# Altium schematic sheet stm32h750.SchDoc
size A3; SheetNumber: 16; SheetTotal: 18
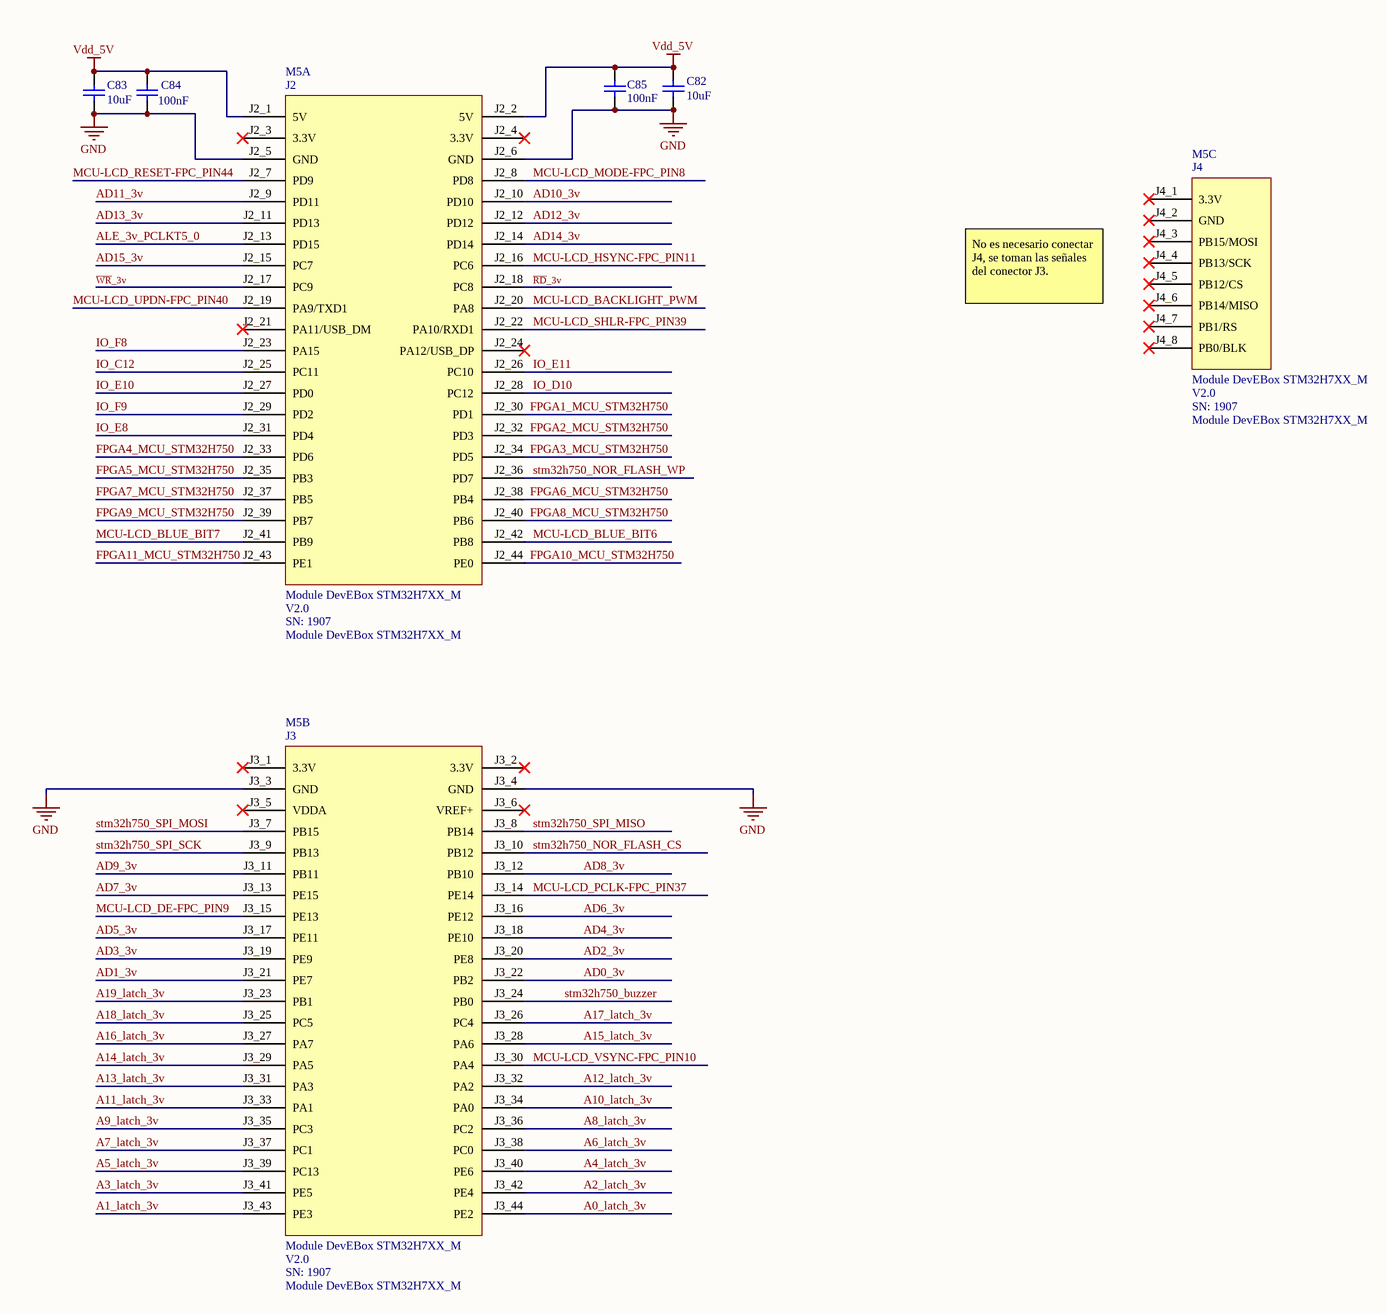
[diagram p0: stm32h750.SchDoc]

## Parts
C82  value 10uF  [capacitor 0603]  (hidden comment: ceramic capacitor)
C83  value 10uF  [capacitor 0603]  (hidden comment: ceramic capacitor)
C84  value 100nF  [capacitor 0603]  (hidden comment: Ceramic capacitor)
C85  value 100nF  [capacitor 0603]  (hidden comment: Ceramic capacitor)
M5  Module DevEBox STM32H7XX_M  [Module DevEBox STM32H7XX_M]  (parts A,B,C of 3)

## Nets
GND: C82.1 C83.1 C84.1 C85.1 M5.J2_5(GND) M5.J2_6(GND) M5.J3_3(GND) M5.J3_4(GND)
Vdd_5V: C82.2 C83.2 C84.2 C85.2 M5.J2_1(5V) M5.J2_2(5V)
A0_latch_3v: M5.J3_44(PE2)
A1_latch_3v: M5.J3_43(PE3)
A2_latch_3v: M5.J3_42(PE4)
A3_latch_3v: M5.J3_41(PE5)
A4_latch_3v: M5.J3_40(PE6)
A5_latch_3v: M5.J3_39(PC13)
A6_latch_3v: M5.J3_38(PC0)
A7_latch_3v: M5.J3_37(PC1)
A8_latch_3v: M5.J3_36(PC2)
A9_latch_3v: M5.J3_35(PC3)
A10_latch_3v: M5.J3_34(PA0)
A11_latch_3v: M5.J3_33(PA1)
A12_latch_3v: M5.J3_32(PA2)
A13_latch_3v: M5.J3_31(PA3)
A14_latch_3v: M5.J3_29(PA5)
A15_latch_3v: M5.J3_28(PA6)
A16_latch_3v: M5.J3_27(PA7)
A17_latch_3v: M5.J3_26(PC4)
A18_latch_3v: M5.J3_25(PC5)
A19_latch_3v: M5.J3_23(PB1)
AD0_3v: M5.J3_22(PB2)
AD1_3v: M5.J3_21(PE7)
AD2_3v: M5.J3_20(PE8)
AD3_3v: M5.J3_19(PE9)
AD4_3v: M5.J3_18(PE10)
AD5_3v: M5.J3_17(PE11)
AD6_3v: M5.J3_16(PE12)
AD7_3v: M5.J3_13(PE15)
AD8_3v: M5.J3_12(PB10)
AD9_3v: M5.J3_11(PB11)
AD10_3v: M5.J2_10(PD10)
AD11_3v: M5.J2_9(PD11)
AD12_3v: M5.J2_12(PD12)
AD13_3v: M5.J2_11(PD13)
AD14_3v: M5.J2_14(PD14)
AD15_3v: M5.J2_15(PC7)
ALE_3v_PCLKT5_0: M5.J2_13(PD15)
FPGA1_MCU_STM32H750: M5.J2_30(PD1)
FPGA2_MCU_STM32H750: M5.J2_32(PD3)
FPGA3_MCU_STM32H750: M5.J2_34(PD5)
FPGA4_MCU_STM32H750: M5.J2_33(PD6)
FPGA5_MCU_STM32H750: M5.J2_35(PB3)
FPGA6_MCU_STM32H750: M5.J2_38(PB4)
FPGA7_MCU_STM32H750: M5.J2_37(PB5)
FPGA8_MCU_STM32H750: M5.J2_40(PB6)
FPGA9_MCU_STM32H750: M5.J2_39(PB7)
FPGA10_MCU_STM32H750: M5.J2_44(PE0)
FPGA11_MCU_STM32H750: M5.J2_43(PE1)
IO_C12: M5.J2_25(PC11)
IO_D10: M5.J2_28(PC12)
IO_E8: M5.J2_31(PD4)
IO_E10: M5.J2_27(PD0)
IO_E11: M5.J2_26(PC10)
IO_F8: M5.J2_23(PA15)
IO_F9: M5.J2_29(PD2)
MCU-LCD_BACKLIGHT_PWM: M5.J2_20(PA8)
MCU-LCD_BLUE_BIT6: M5.J2_42(PB8)
MCU-LCD_BLUE_BIT7: M5.J2_41(PB9)
MCU-LCD_DE-FPC_PIN9: M5.J3_15(PE13)
MCU-LCD_HSYNC-FPC_PIN11: M5.J2_16(PC6)
MCU-LCD_MODE-FPC_PIN8: M5.J2_8(PD8)
MCU-LCD_PCLK-FPC_PIN37: M5.J3_14(PE14)
MCU-LCD_RESET-FPC_PIN44: M5.J2_7(PD9)
MCU-LCD_SHLR-FPC_PIN39: M5.J2_22(PA10/RXD1)
MCU-LCD_UPDN-FPC_PIN40: M5.J2_19(PA9/TXD1)
MCU-LCD_VSYNC-FPC_PIN10: M5.J3_30(PA4)
~{RD}_3v: M5.J2_18(PC8)
stm32h750_buzzer: M5.J3_24(PB0)
stm32h750_NOR_FLASH_CS: M5.J3_10(PB12)
stm32h750_NOR_FLASH_WP: M5.J2_36(PD7)
stm32h750_SPI_MISO: M5.J3_8(PB14)
stm32h750_SPI_MOSI: M5.J3_7(PB15)
stm32h750_SPI_SCK: M5.J3_9(PB13)
~{WR}_3v: M5.J2_17(PC9)

Not connected (* = marked no-connect by the designer): M5 J2_3(3.3V)* J2_4(3.3V)* J2_21(PA11/USB_DM)* J2_24(PA12/USB_DP)* J3_1(3.3V)* J3_2(3.3V)* J3_5(VDDA)* J3_6(VREF+)* J4_1(3.3V)* J4_2(GND)* J4_3(PB15/MOSI)* J4_4(PB13/SCK)* J4_5(PB12/CS)* J4_6(PB14/MISO)* J4_7(PB1/RS)* J4_8(PB0/BLK)*

## Notes on the sheet
- No es necesario conectar J4, se toman las señales del conector J3.
- (in symbol Module DevEBox STM32H7XX_M, part A) J2; V2.0; SN: 1907
- (in symbol Module DevEBox STM32H7XX_M, part B) J3; V2.0; SN: 1907
- (in symbol Module DevEBox STM32H7XX_M, part C) J4; V2.0; SN: 1907

## Library data of the parts
C82 C83 = ceramic capacitor: Multilayer ceramic capacitor; V: 6.3; LCSC part: C1691; Package: 0603
C84 C85 = Ceramic capacitor: Multilayer ceramic capacitor; V: 50; LCSC part: C14663; Package: 0603
M5 = Module DevEBox STM32H7XX_M: Module DevEBox STM32H7XX_M / V2.0 / SN: 1907